# Altium project Terminal Board V1.PrjPcb
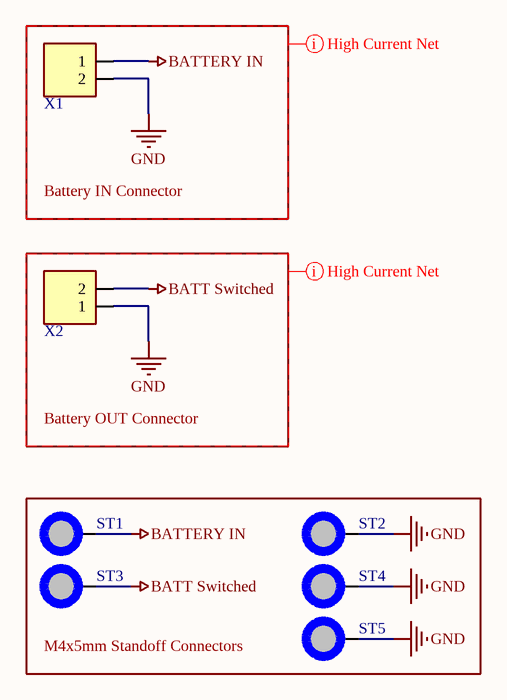
[diagram p0: Connectors.SchDoc]
1 sheet, 7 parts. Net scope: global (net labels, ports and power ports of the same name join across sheets).
Board file: Layout.PcbDoc

## Sheet Connectors.SchDoc
size A; SheetNumber: 1; SheetTotal: 1

### Parts
ST1  M4 5mm  [[Standoff] M4 5mm]  (value not drawn)
ST2  M4 x 3.2mm  [[Bolt] M4 Nut h=3.2mm]  (value not drawn)
ST3  M4 5mm  [[Standoff] M4 5mm]  (value not drawn)
ST4  M4 x 3.2mm  [[Bolt] M4 Nut h=3.2mm]  (value not drawn)
ST5  M4 x 3.2mm  [[Bolt] M4 Nut h=3.2mm]  (value not drawn)
X1  Anderson 2pos Right-Angle  [[Anderson] 2pos Right-Angle w/o MH 1327G17]  (value not drawn)
X2  Anderson 2pos Right-Angle  [[Anderson] 2pos Right-Angle w/o MH 1327G17]  (value not drawn)

### Blocks framed on the sheet
Battery IN Connector: X1
Battery OUT Connector: X2
M4x5mm Standoff Connectors: ST1-ST5

### Nets
BATT Switched: ST3.1 X2.2
BATTERY IN: ST1.1 X1.1
GND: ST2.1 ST4.1 ST5.1 X1.2 X2.1

### Layout directives
net class High_Current_Nets: BATT Switched, BATTERY IN, GND

### Library data of the parts
ST1 ST3 = [Standoff] M4 5mm: 971050474; System: Connector; Supplier 1: DigiKey; Supplier Part Number 1: 732-12900-ND
ST2 ST4 ST5 = [Bolt] M4 Nut h=3.2mm: 90591A255; System: Connector
X1 X2 = [Anderson] 2pos Right-Angle w/o MH